# EAGLE design WEMOS_ESP32_2S_V4_for_S3 (EAGLE 9.6.2)
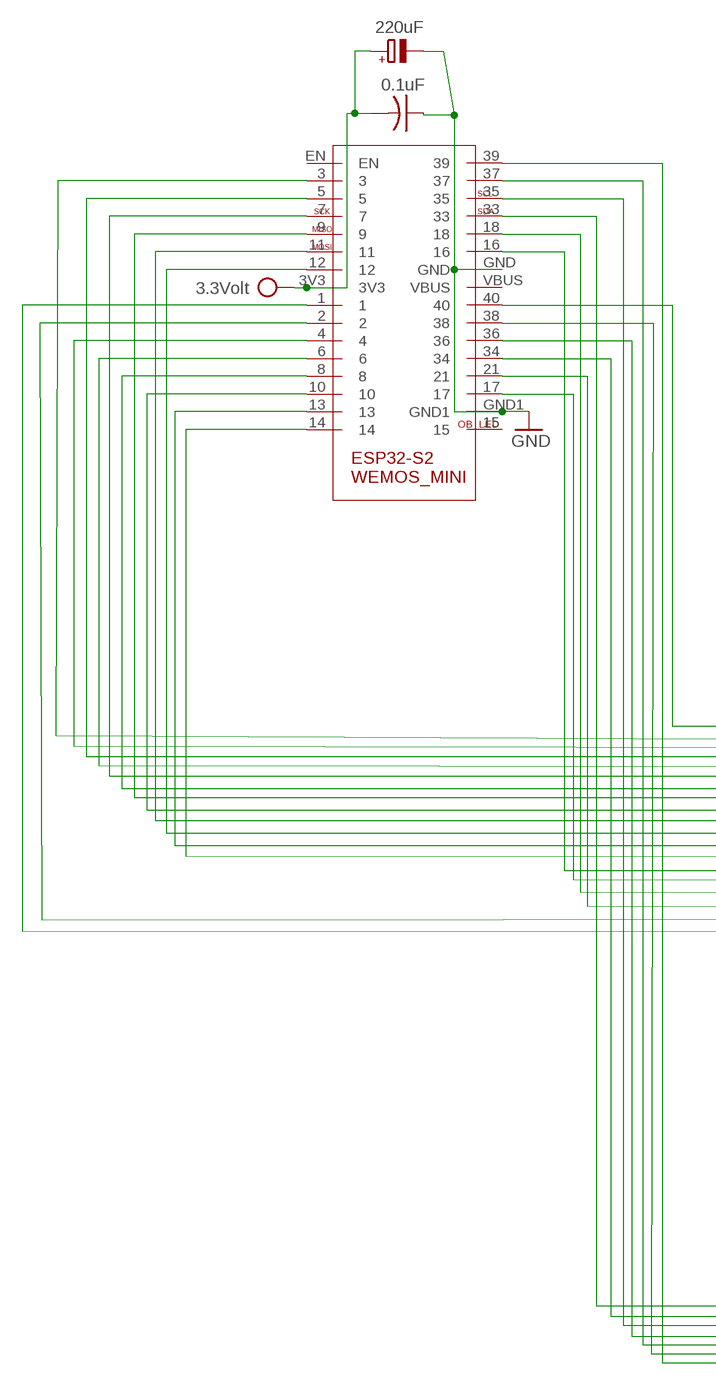
[diagram p0: schematic, sheet 1, part 1 of 2]
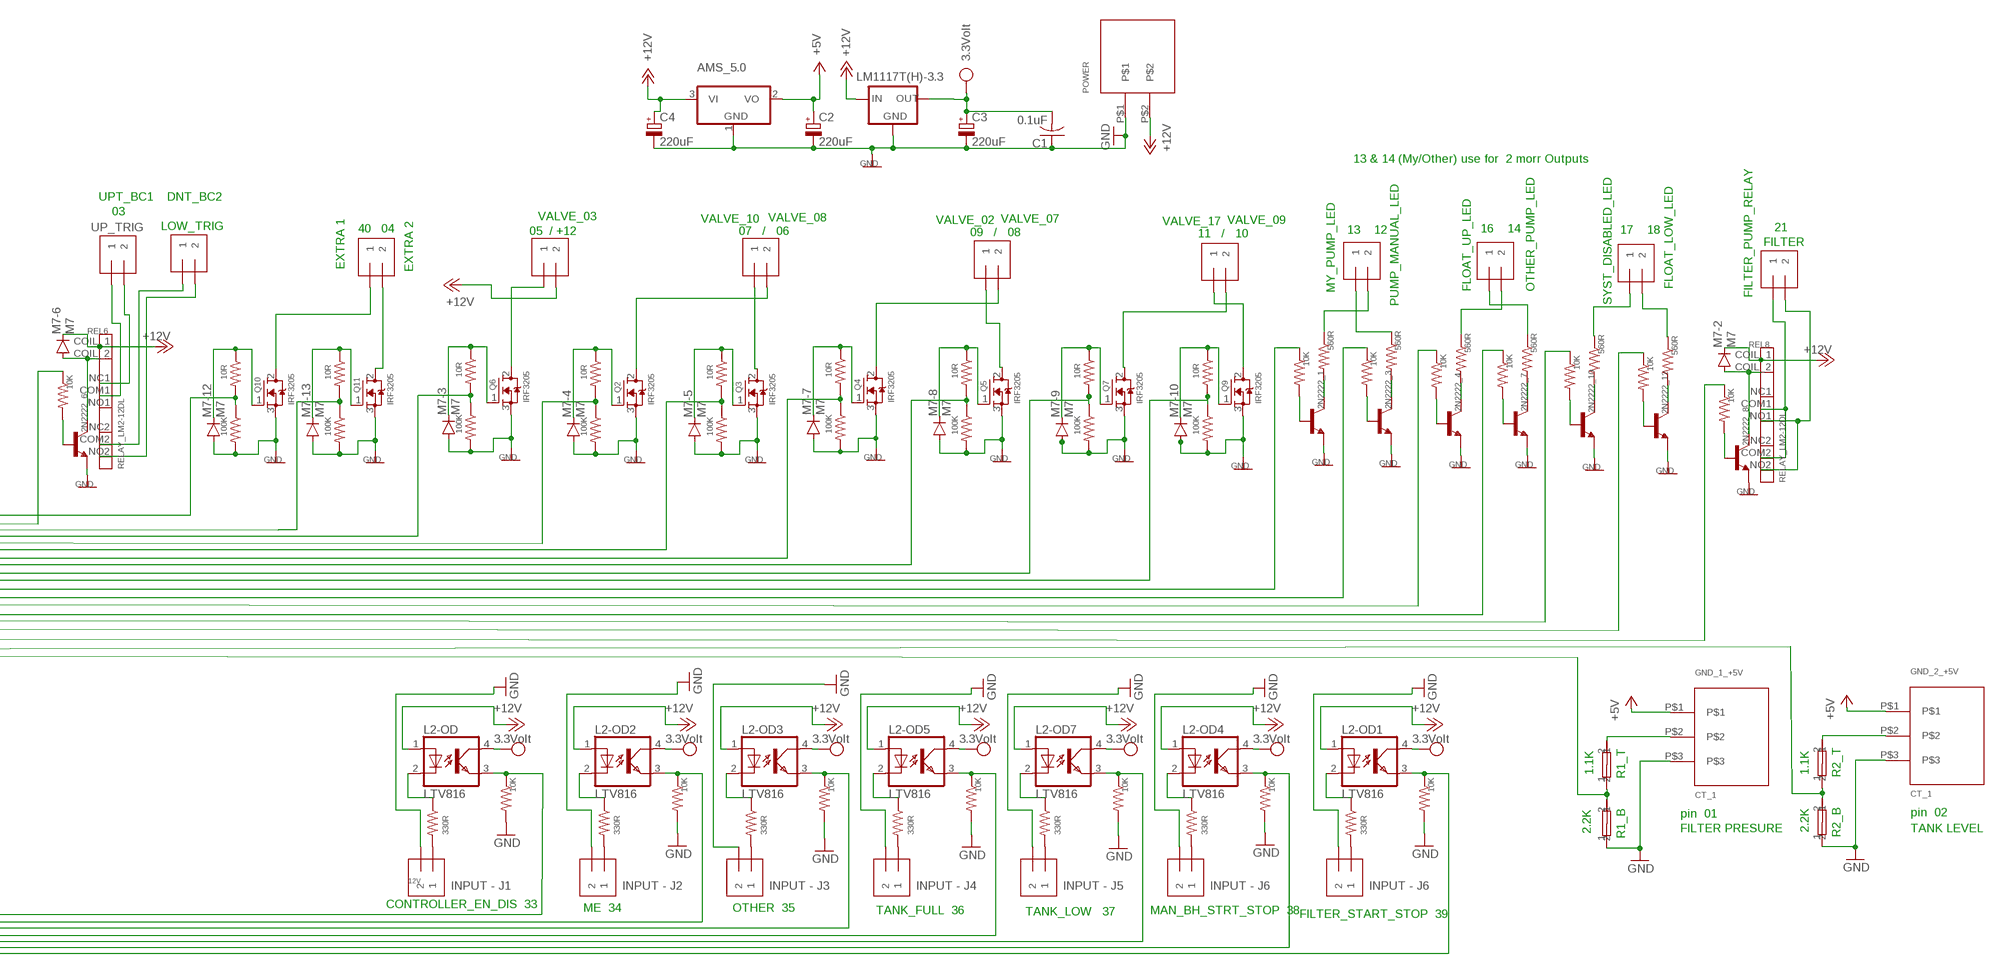
[diagram p1: schematic, sheet 1, part 2 of 2]

## Parts
2N2222_1  2N3904  [TO92]
2N2222_3  2N3904  [TO92]
2N2222_4  2N3904  [TO92]
2N2222_6  2N3904  [TO92]
2N2222_7  2N3904  [TO92]
2N2222_8  2N3904  [TO92]
2N2222_10  2N3904  [TO92]
2N2222_12  2N3904  [TO92]
06__07  FLOAT  TERMINNAL-3.5MM-2-3.5MMDOUBLE  [1X2-3.5MM]
08__09  FLOAT  TERMINNAL-3.5MM-2-3.5MMDOUBLE  [1X2-3.5MM]
10__11  FLOAT  TERMINNAL-3.5MM-2-3.5MMDOUBLE  [1X2-3.5MM]
12__13  FLOAT  TERMINNAL-3.5MM-2-3.5MMDOUBLE  [1X2-3.5MM]
14__16  FLOAT  TERMINNAL-3.5MM-2-3.5MMDOUBLE  [1X2-3.5MM]
18__17  FLOAT  TERMINNAL-3.5MM-2-3.5MMDOUBLE  [1X2-3.5MM]
40__04  FLOAT  TERMINNAL-3.5MM-2-3.5MMDOUBLE  [1X2-3.5MM]
+12V_05  FLOAT  TERMINNAL-3.5MM-2-3.5MMDOUBLE  [1X2-3.5MM]
+_33  AAA  TERMINNAL-3.5MM-2-3.5MMDOUBLE  [1X2-3.5MM]
+_34  TERMINNAL-3.5MM-2-3.5MMDOUBLE  [1X2-3.5MM]
+_35  TERMINNAL-3.5MM-2-3.5MMDOUBLE  [1X2-3.5MM]
+_36  TERMINNAL-3.5MM-2-3.5MMDOUBLE  [1X2-3.5MM]
+_37  TERMINNAL-3.5MM-2-3.5MMDOUBLE  [1X2-3.5MM]
+_38  TERMINNAL-3.5MM-2-3.5MMDOUBLE  [1X2-3.5MM]
+_39  TERMINNAL-3.5MM-2-3.5MMDOUBLE  [1X2-3.5MM]
AMS_5.0  AMS1117DB  [SOT223]
C1  0.1uF  C-US050-025X075  [C050-025X075]
C2  220uF  CPOL-EUE2.5-7  [E2,5-7]
C3  220uF  CPOL-EUE2.5-7  [E2,5-7]
C4  220uF  CPOL-EUE2.5-7  [E2,5-7]
C5  0.1uF  C-US050-025X075  [C050-025X075]
C6  220uF  CPOL-EUE2.5-7  [E2,5-7]
DNT_03  FLOAT  TERMINNAL-3.5MM-2-3.5MMDOUBLE  [1X2-3.5MM]
FIL__21  FILTER  TERMINNAL-3.5MM-2-3.5MMDOUBLE  [1X2-3.5MM]
GND_1_+5V  CT_1  TERMINAL-3.5MM-3TERMINAL  [1X3-3.5MM_TERM]
GND_2_+5V  CT_1  TERMINAL-3.5MM-3TERMINAL  [1X3-3.5MM_TERM]
IC1  LM1117T(H)-3.3  [TO220H]
L2-OD  LTV816  [DIL04]
L2-OD1  LTV816  [DIL04]
L2-OD2  LTV816  [DIL04]
L2-OD3  LTV816  [DIL04]
L2-OD4  LTV816  [DIL04]
L2-OD5  LTV816  [DIL04]
L2-OD7  LTV816  [DIL04]
M7-2  M7  DIODE-SOD106-R  [SOD106-R]
M7-3  M7  DIODE-SOD106-R  [SOD106-R]
M7-4  M7  DIODE-SOD106-R  [SOD106-R]
M7-5  M7  DIODE-SOD106-R  [SOD106-R]
M7-6  M7  DIODE-SOD106-R  [SOD106-R]
M7-7  M7  DIODE-SOD106-R  [SOD106-R]
M7-8  M7  DIODE-SOD106-R  [SOD106-R]
M7-9  M7  DIODE-SOD106-R  [SOD106-R]
M7-10  M7  DIODE-SOD106-R  [SOD106-R]
M7-12  M7  DIODE-SOD106-R  [SOD106-R]
M7-13  M7  DIODE-SOD106-R  [SOD106-R]
POWER  TERMINAL-5.08MM-2BIG_HOLE  [TERM-5.05-2_BH]
Q2  IRF3205  MOSFET-NGDS_TO220V  [TO220V]
Q3  IRF3205  MOSFET-NGDS_TO220V  [TO220V]
Q4  IRF3205  MOSFET-NGDS_TO220V  [TO220V]
Q5  IRF3205  MOSFET-NGDS_TO220V  [TO220V]
Q6  IRF3205  MOSFET-NGDS_TO220V  [TO220V]
Q7  IRF3205  MOSFET-NGDS_TO220V  [TO220V]
Q9  IRF3205  MOSFET-NGDS_TO220V  [TO220V]
Q10  IRF3205  MOSFET-NGDS_TO220V  [TO220V]
Q11  IRF3205  MOSFET-NGDS_TO220V  [TO220V]
R1  10K  R-US_R0805  [R0805]
R1_B  2.2K  RESISTOR  [0207/10]
R1_B1  2.2k  RESISTOR  [0207/10]
R1_T  1.1K  RESISTOR  [0207/10]
R2  100K  R-US_R0805  [R0805]
R2_T1  1.1K  RESISTOR  [0207/10]
R3  330R  R-US_R0805  [R0805]
R4  560R  R-US_R0805  [R0805]
R5  10R  R-US_R0805  [R0805]
R6  100K  R-US_R0805  [R0805]
R7  10K  R-US_R0805  [R0805]
R8  10R  R-US_R0805  [R0805]
R9  100K  R-US_R0805  [R0805]
R10  10K  R-US_R0805  [R0805]
R11  10R  R-US_R0805  [R0805]
R12  330R  R-US_R0805  [R0805]
R13  10K  R-US_R0805  [R0805]
R14  330R  R-US_R0805  [R0805]
R15  10K  R-US_R0805  [R0805]
R16  330R  R-US_R0805  [R0805]
R17  10K  R-US_R0805  [R0805]
R18  330R  R-US_R0805  [R0805]
R19  10K  R-US_R0805  [R0805]
R20  100K  R-US_R0805  [R0805]
R22  330R  R-US_R0805  [R0805]
R23  10K  R-US_R0805  [R0805]
R24  10K  R-US_R0805  [R0805]
R25  10R  R-US_R0805  [R0805]
R26  100K  R-US_R0805  [R0805]
R27  10R  R-US_R0805  [R0805]
R28  100K  R-US_R0805  [R0805]
R29  330R  R-US_R0805  [R0805]
R30  10K  R-US_R0805  [R0805]
R31  10R  R-US_R0805  [R0805]
R32  100K  R-US_R0805  [R0805]
R34  10K  R-US_R0805  [R0805]
R35  560R  R-US_R0805  [R0805]
R36  10K  R-US_R0805  [R0805]
R37  560R  R-US_R0805  [R0805]
R38  10R  R-US_R0805  [R0805]
R40  10K  R-US_R0805  [R0805]
R41  560R  R-US_R0805  [R0805]
R43  10R  R-US_R0805  [R0805]
R44  10K  R-US_R0805  [R0805]
R45  560R  R-US_R0805  [R0805]
R46  100K  R-US_R0805  [R0805]
R47  10R  R-US_R0805  [R0805]
R48  10K  R-US_R0805  [R0805]
R49  560R  R-US_R0805  [R0805]
R50  100K  R-US_R0805  [R0805]
REL6  RELAY_LM2-12DL  [RELAY4078]
REL8  RELAY_LM2-12DL  [RELAY4078]
U$1  WEMOS_S2_MINI  [WEMOS_S2_MINI]
UPT_03  FLOAT  TERMINNAL-3.5MM-2-3.5MMDOUBLE  [1X2-3.5MM]

## Nets
+5V [12V]: AMS_5.0.2(VO) C2.+ GND_1_+5V.P$1 GND_2_+5V.P$1
+12V [12V]: +12V_05.2 AMS_5.0.3(VI) C4.+ IC1.3(IN) L2-OD1.1(A) L2-OD2.1(A) L2-OD3.1(A) L2-OD4.1(A) L2-OD5.1(A) L2-OD7.1(A) L2-OD.1(A) M7-2.C M7-6.C POWER.P$2 REL6.COIL_1(COIL1) REL8.COIL_1(COIL1)
GND [GND]: 2N2222_1.3(E) 2N2222_3.3(E) 2N2222_4.3(E) 2N2222_6.3(E) 2N2222_7.3(E) 2N2222_8.3(E) 2N2222_10.3(E) 2N2222_12.3(E) +_33.2 +_34.2 +_35.2 +_36.2 +_37.2 +_38.2 +_39.2 AMS_5.0.1(GND) C1.1 C2.- C3.- C4.- C5.1 C6.- GND_1_+5V.P$3 GND_2_+5V.P$3 IC1.1(GND) M7-3.A M7-4.A M7-5.A M7-7.A M7-8.A M7-9.A M7-10.A M7-12.A M7-13.A POWER.P$1 Q2.3(S) Q3.3(S) Q4.3(S) Q5.3(S) Q6.3(S) Q7.3(S) Q9.3(S) Q10.3(S) Q11.3(S) R1_B1.1 R1_B.1 R2.2 R6.2 R7.2 R9.2 R13.2 R15.2 R17.2 R19.2 R20.2 R23.2 R26.2 R28.2 R30.2 R32.2 R46.2 R50.2 U$1.GND U$1.GND1
N$1 [POWER]: 08__09.1 Q5.2(D)
N$2: 2N2222_6.2(B) R10.2
N$3: REL6.COM1 UPT_03.1
N$4: R47.2 R50.1 U$1.4
N$5: L2-OD.2(C) R3.1
N$6: R43.2 R46.1 U$1.40
N$7: M7-3.C Q6.1(G) R38.1
N$8: R2.1 R38.2 U$1.5
N$9 [POWER]: 10__11.2 Q7.2(D)
N$10: R1_B1.2 R2_T1.1 U$1.2
N$11: 2N2222_8.2(B) R24.2
N$12 [POWER]: 40__04.2 Q11.2(D)
N$13 [POWER]: 06__07.2 Q2.2(D)
N$14: 2N2222_1.1(C) R4.2
N$15 [POWER]: 06__07.1 Q3.2(D)
N$16: M7-7.C Q4.1(G) R11.1
N$17: R10.1 U$1.3
N$18: R11.2 R20.1 U$1.8
N$19 [POWER]: 08__09.2 Q4.2(D)
N$20: L2-OD1.2(C) R29.1
N$21: +_39.1 R29.2
N$22 [POWER]: +12V_05.1 Q6.2(D)
N$23: M7-4.C Q2.1(G) R5.1
N$24: R5.2 R6.1 U$1.6
N$25: R1.1 U$1.12
N$26: M7-5.C Q3.1(G) R8.1
N$27: R8.2 R9.1 U$1.7
N$28: +_33.1 R3.2
N$29: M7-8.C Q5.1(G) R25.1
N$30: R25.2 R26.1 U$1.9
N$31: 2N2222_1.2(B) R1.2
N$32: M7-9.C Q7.1(G) R27.1
N$33: R27.2 R28.1 U$1.10
N$34: 12__13.2 R4.1
N$35: L2-OD7.3(EMIT) R23.1 U$1.37
N$36: 12__13.1 R35.1
N$37: 14__16.2 R37.1
N$38 [POWER]: 10__11.1 Q9.2(D)
N$39: M7-10.C Q9.1(G) R31.1
N$40: R31.2 R32.1 U$1.11
N$41: L2-OD2.3(EMIT) R13.1 U$1.34
N$42: L2-OD.3(EMIT) R7.1 U$1.33
N$43: R34.1 U$1.13
N$44: 2N2222_3.2(B) R34.2
N$45: 2N2222_3.1(C) R35.2
N$46: L2-OD1.3(EMIT) R30.1 U$1.39
N$47: L2-OD2.2(C) R12.1
N$48: R36.1 U$1.14
N$49: R1_B.2 R1_T.1 U$1.1
N$50: 2N2222_4.2(B) R36.2
N$51: 2N2222_4.1(C) R37.2
N$52: 14__16.1 R41.1
N$53: 18__17.1 R45.1
N$54: 18__17.2 R49.1
N$55: +_34.1 R12.2
N$56: L2-OD5.3(EMIT) R19.1 U$1.36
N$57: GND_1_+5V.P$2 R1_T.2
N$58: L2-OD3.2(C) R14.1
N$59: GND_2_+5V.P$2 R2_T1.2
N$60: +_35.1 R14.2
N$61: L2-OD3.3(EMIT) R15.1 U$1.35
N$62: 2N2222_6.1(C) M7-6.A REL6.COIL_2(COIL2)
N$63: DNT_03.2 REL6.NO2
N$64: R40.1 U$1.16
N$65: REL6.NC1 UPT_03.2
N$66: 2N2222_7.2(B) R40.2
N$67: 2N2222_7.1(C) R41.2
N$68: DNT_03.1 REL6.COM2
N$69: L2-OD4.2(C) R16.1
N$70 [POWER]: 40__04.1 Q10.2(D)
N$71: +_38.1 R16.2
N$72: L2-OD4.3(EMIT) R17.1 U$1.38
N$74: L2-OD5.2(C) R18.1
N$76: +_36.1 R18.2
N$78: M7-12.C Q10.1(G) R43.1
N$79: R44.1 U$1.17
N$80: 2N2222_10.2(B) R44.2
N$81: 2N2222_10.1(C) R45.2
N$83: M7-13.C Q11.1(G) R47.1
N$84: L2-OD7.2(C) R22.1
N$86: +_37.1 R22.2
N$89: R48.1 U$1.18
N$90: 2N2222_12.2(B) R48.2
N$91: 2N2222_12.1(C) R49.2
N$101: 2N2222_8.1(C) M7-2.A REL8.COIL_2(COIL2)
N$103 [POWER]: FIL__21.2 REL8.NO1 REL8.NO2
N$106 [POWER]: FIL__21.1 REL8.COM1 REL8.COM2
N$109: R24.1 U$1.21
VCC [3V]: C1.2 C3.+ C5.2 C6.+ IC1.2(OUT) L2-OD1.4(COL) L2-OD2.4(COL) L2-OD3.4(COL) L2-OD4.4(COL) L2-OD5.4(COL) L2-OD7.4(COL) L2-OD.4(COL) U$1.3V3
Unconnected: REL6.NC2 REL6.NO1 REL8.NC1 REL8.NC2 U$1.15 U$1.EN U$1.VBUS

## Notes on the sheet
- 13 & 14 (My/Other) use for  2 morr Outputs
- UPT_BC1 | DNT_BC2
- 03
- VALVE_03 | VALVE_10 | VALVE_08 | VALVE_07
- VALVE_02 | VALVE_17 | VALVE_09
- UP_TRIG | LOW_TRIG | 40 | 04 | 16 | 14 | 21
- 05  / +12 | 07   /   06 | 09   /   08 | 13 | 12 | 17 | 18
- 11   /   10
- FILTER
- EXTRA 1 | EXTRA 2
- FLOAT_UP_LED | OTHER_PUMP_LED | FLOAT_LOW_LED
- MY_PUMP_LED
- FILTER_PUMP_RELAY
- PUMP_MANUAL_LED | SYST_DISABLED_LED
- 1.1K | 1.1K | R2_T
- R1_T
- pin  01 | pin  02
- 2.2K | FILTER PRESURE | 2.2K | TANK LEVEL
- R1_B | R2_B
- 12V
- INPUT - J1 | INPUT - J2 | INPUT - J3 | INPUT - J4 | INPUT - J5 | INPUT - J6 | INPUT - J6
- CONTROLLER_EN_DIS  33
- ME  34 | OTHER  35 | TANK_FULL  36 | MAN_BH_STRT_STOP  38
- TANK_LOW   37 | FILTER_START_STOP  39

## Library data of the parts
2N2222_1 2N2222_3 2N2222_4 2N2222_6-2N2222_8 2N2222_10 2N2222_12 = transistor:2N3904: NPN TRANSISTOR
06__07 08__09 10__11 12__13 14__16 18__17 40__04 +12V_05 +_33-+_39 DNT_03 FIL__21 UPT_03 = BDV_02:TERMINNAL-3.5MM-2: 3.5mm Terminal block http://www.ladyada.net/library/pcb/eaglelibrary.html
AMS_5.0 = BDV_01:AMS1117: 250 mA, 16V, Low Quiescent Current LDO Regulator Source: http://ww1.microchip.com/downloads/en/DeviceDoc/22049b.pdf
C1 C5 = adafruit:C-US: CAPACITOR, American symbol
C2-C4 C6 = resistor:CPOL-EU: POLARIZED CAPACITOR, European symbol
GND_1_+5V GND_2_+5V = BDV_02:TERMINAL-3.5MM-3: 3 Pin Connector
IC1 = lm1117_10:LM1117?-*: 800mA Low-Dropout Linear Regulator Source: http://www.ti.com/lit/ds/symlink/lm1117-n.pdf; MF: Texas Instruments; MPN: LM1117T-3.3; OC_FARNELL: 1469056; OC_NEWARK: 13B5347
L2-OD L2-OD1-L2-OD5 L2-OD7 = optocoupler:LTV816: OPTO COUPLER Source: LITEON, LTV816.pdf; OC_FARNELL: unknown; OC_NEWARK: unknown
M7-2-M7-10 M7-12 M7-13 = diode:DIODE-: DIODE
POWER = BDV_02:TERMINAL-5.08MM-2: Terminal 5.08mm - 2
Q2-Q7 Q9-Q11 = adafruit:MOSFET-N: N-Channel Mosfet 2N7002E - 60V 260mA SOT23 [Digikey: 2N7002ET1GOSTR-ND] - REEL BSH103 - 30V 850mA SOT23 [Digikey: 568-5013-1-ND]
R1-R20 R22-R32 R34-R38 R40 R41 R43-R50 = resistor:R-US_: RESISTOR, American symbol
R1_B R1_B1 R1_T R2_T1 = BDV_02:RESISTOR
REL6 REL8 = BDV_02:RELAY_LM2-12DL: Relay Small Symbol
U$1 = BDV_02:WEMOS_S2_MINI: WEMOS_MINI

## Net classes
0 default: width 0.305 mm, drill 0.305 mm, clearance 0.305 mm
1 POWER: width 0.889 mm, drill 0.508 mm, clearance 0.305 mm to class 0, clearance 0.508 mm
2 12V: width 0.889 mm, drill 0.508 mm, clearance 0.305 mm to class 0, clearance 0.508 mm
3 ground: width 0.889 mm, drill 0.508 mm, clearance 0.305 mm to class 0, clearance 0.305 mm to class 1, clearance 0.305 mm to class 2, clearance 0.305 mm
4 3V: width 0.635 mm, drill 0.508 mm, clearance 0.305 mm to class 0, clearance 0.508 mm
5 GND: width 0.889 mm, drill 0.508 mm, clearance 0.305 mm to class 0, clearance 0.508 mm

## Board
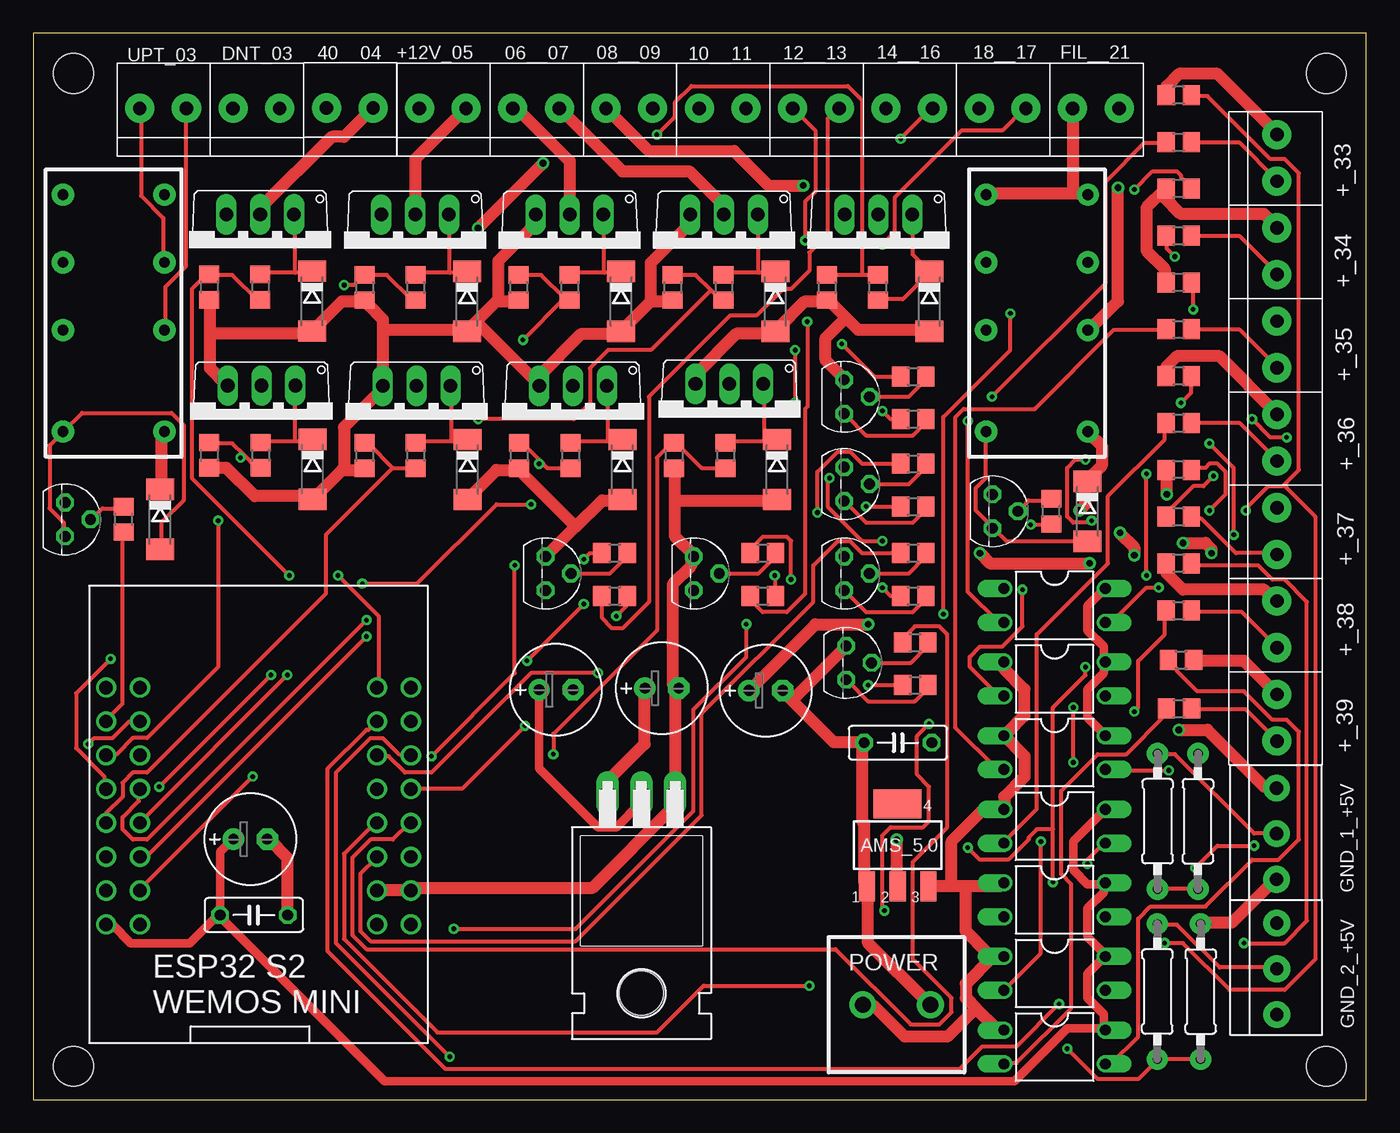
[diagram p2: board, top side]
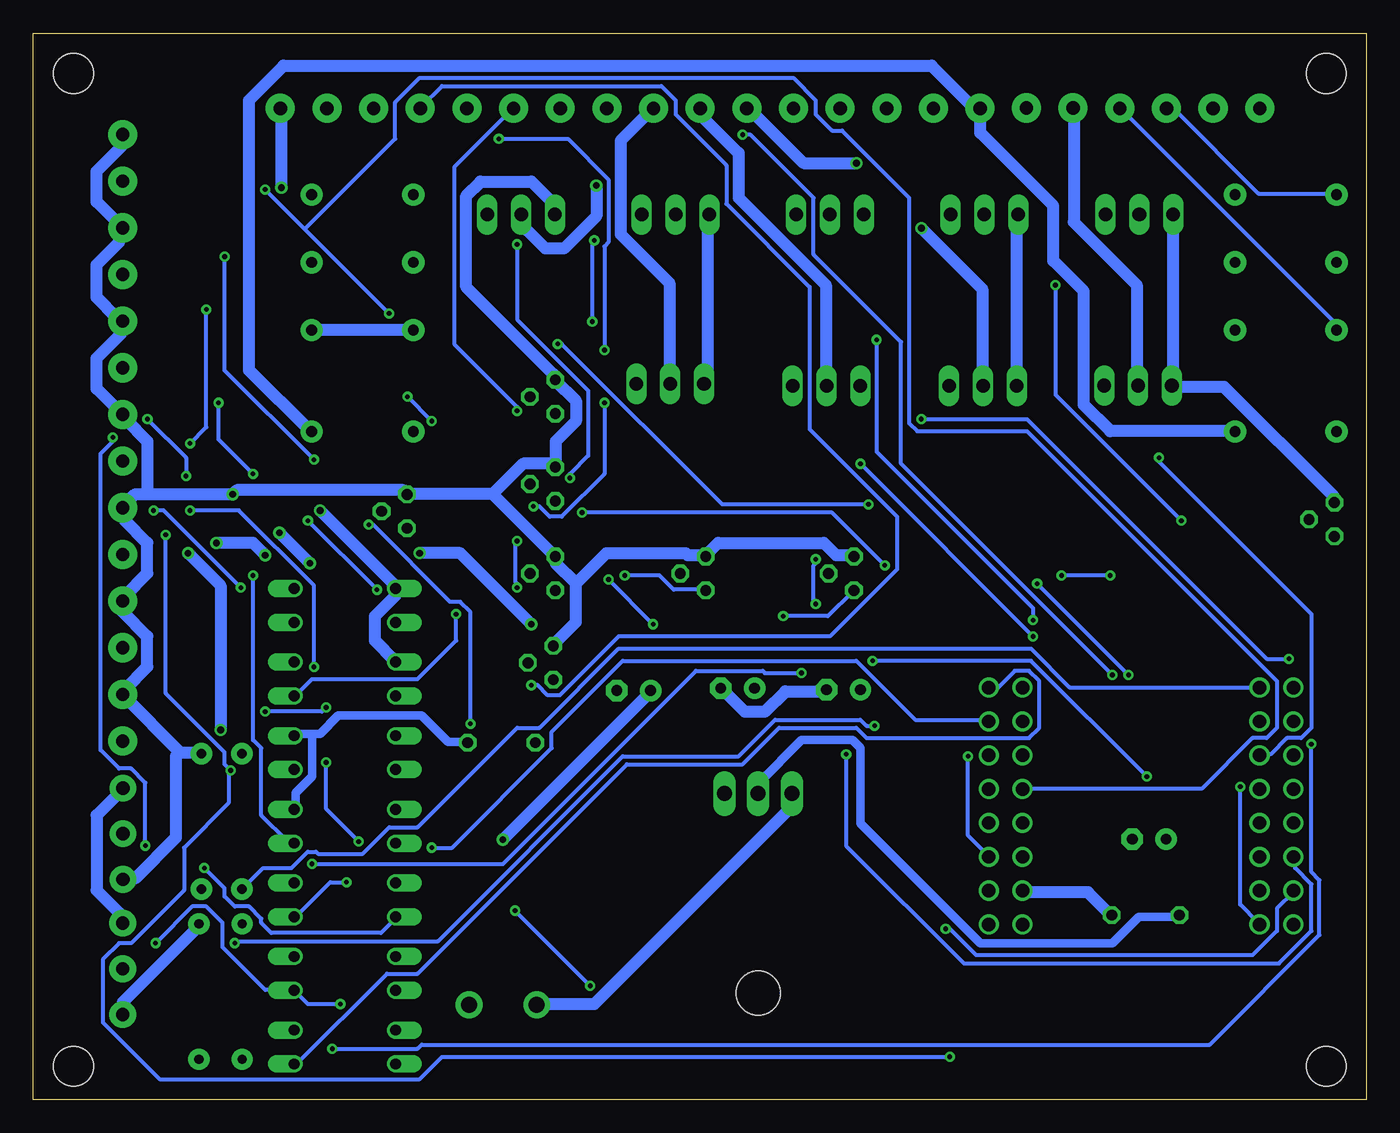
[diagram p3: board, bottom side, seen from below]

Size 100 x 80 mm. Coordinates in mm from the lower left corner, seen from the top.
Outline: 0,0 100,0 100,80 0,80 0,0
Copper layers (1*16): Top 0.035mm / dielectric 1.5mm / Bottom 0.035mm
Design rules "default *": minimum track width 6mil, minimum drill 0.35mm, track to track 6mil, track to pad 6mil, pad to pad 6mil, via to via 6mil, smd to smd 6mil, copper to edge 40mil, drill to drill 6mil, minimum pad ring 10mil, minimum via ring 8mil, stop-mask expansion 4mil, vias tented up to drill 20mil, thermal gap 10mil
Holes 3 mm at 3,77 3,2.5 97,2.5 97,77

### Footprints (pad centres in the part's own frame; a part is rotated, then mirrored left to right if it is on the bottom)
TO92 = drill 0.813 octagon: 1 1.27,0; 2 0,1.905; 3 -1.27,0
1X2-3.5MM = drill 1 pad 2.184: 1 1.8,0; 2 -1.7,0
SOT223 = smd 1.219 x 2.235: 1 -2.311,-3.099; 2 0,-3.099; 3 2.311,-3.099 | smd 3.6 x 2.2: 4 0,3.099
C050-025X075 = drill 0.813 octagon: 1 -2.54,0; 2 2.54,0
E2,5-7 = drill 0.813 pad 1.6: + -1.27,0 | drill 0.813 pad 1.6 octagon: - 1.27,0
1X3-3.5MM_TERM = drill 1 pad 2: P$1 -3.32,-0.586; P$2 0.1,-0.586; P$3 3.52,-0.586
TO220H = drill 1.118 long: 1 -2.54,-10.16; 2 0,-10.16; 3 2.54,-10.16 | hole 3.302: 0,4.826
DIL04 = drill 0.813 offset: 1 -1.27,-3.81; 2 1.27,-3.81; 3 1.27,3.81; 4 -1.27,3.81
SOD106-R = smd 1.6 x 2.1: A 2.25,0; C -2.25,0
TERM-5.05-2_BH = drill 1.2 pad 2: P$1 0,2.54; P$2 0,-2.54
TO220V = drill 1.016 long: 1 -2.54,-2.54; 2 0,-2.54; 3 2.54,-2.54
R0805 = smd 1.3 x 1.5: 1 -0.95,0; 2 0.95,0
0207/10 = drill 0.7 pad 1.6: 1 -5.08,0; 2 5.08,0
RELAY4078 = drill 0.8 pad 1.676: COIL_1 -3.81,8.89; COIL_2 3.81,8.89; COM1 -3.81,1.27; COM2 3.81,1.27; NC1 -3.81,-3.81; NC2 3.81,-3.81; NO1 -3.81,-8.89; NO2 3.81,-8.89
WEMOS_S2_MINI = drill 1: 1 -8.89,10.16; 2 -8.89,7.62; 3 -11.43,7.62; 3V3 -11.43,-7.62; 4 -8.89,5.08; 5 -11.43,5.08; 6 -8.89,2.54; 7 -11.43,2.54; 8 -8.89,0; 9 -11.43,0; 10 -8.89,-2.54; 11 -11.43,-2.54; 12 -11.43,-5.08; 13 -8.89,-5.08; 14 -8.89,-7.62; 15 8.89,-7.62; 16 11.43,-2.54; 17 8.89,-2.54; 18 11.43,0; 21 8.89,0; 33 11.43,2.54; 34 8.89,2.54; 35 11.43,5.08; 36 8.89,5.08; 37 11.43,7.62; 38 8.89,7.62; 39 11.43,10.16; 40 8.89,10.16; EN -11.43,10.16; GND 11.43,-5.08; GND1 8.89,-5.08; VBUS 11.43,-7.62

### Placement (x,y rotation side)
2N2222_1  49.56,39.47 270 top
2N2222_3  38.43,39.47 270 top
2N2222_4  60.83,52.73 270 top
2N2222_6  2.38,43.53 270 top
2N2222_7  60.83,46.18 270 top
2N2222_8  71.96,44.14 270 top
2N2222_10  60.83,39.47 270 top
2N2222_12  60.99,32.77 270 top
06__07  37.67,74.37 0 top
08__09  44.67,74.37 0 top
10__11  51.67,74.37 0 top
12__13  58.67,74.37 0 top
14__16  65.67,74.37 0 top
18__17  72.67,74.37 0 top
40__04  23.7,74.4 0 top
+12V_05  30.67,74.37 0 top
+_33  93.3,70.7 270 top
+_34  93.3,63.7 270 top
+_35  93.3,56.7 270 top
+_36  93.3,49.7 270 top
+_37  93.3,42.7 270 top
+_38  93.3,35.7 270 top
+_39  93.3,28.7 270 top
AMS_5.0  64.85,19.09 0 top
C1  64.87,26.77 0 top
C2  54.95,30.68 0 top
C3  39.22,30.75 0 top
C4  47.16,30.86 0 top
C5  16.55,13.84 180 top
C6  16.28,19.53 0 top
DNT_03  16.69,74.37 0 top
FIL__21  79.67,74.37 0 top
GND_1_+5V  93.85,20.04 270 top
GND_2_+5V  93.88,9.91 270 top
IC1  45.62,12.8 180 top
L2-OD  76.63,37.07 270 top
L2-OD1  76.63,3.94 270 top
L2-OD2  76.63,31.55 270 top
L2-OD3  76.63,26.03 270 top
L2-OD4  76.63,9.46 270 top
L2-OD5  76.63,20.5 270 top
L2-OD7  76.63,14.98 270 top
M7-2  79.08,44.14 270 top
M7-3  32.54,59.88 270 top
M7-4  44.1,59.88 270 top
M7-5  55.67,59.88 270 top
M7-6  9.5,43.53 270 top
M7-7  67.23,59.88 270 top
M7-8  32.57,47.27 270 top
M7-9  44.19,47.27 270 top
M7-10  55.8,47.27 270 top
M7-12  20.9,59.91 270 top
M7-13  20.94,47.29 270 top
POWER  64.77,7.11 270 top
Q2  40.23,63.86 180 top
Q3  51.82,63.86 180 top
Q4  63.4,63.86 180 top
Q5  28.75,51 180 top
Q6  28.65,63.86 180 top
Q7  40.49,51 180 top
Q9  52.22,51.16 180 top
Q10  17.02,63.88 180 top
Q11  17.12,51.03 180 top
R1  54.74,41 0 top
R1_B  87.38,20.88 270 top
R1_B1  87.58,8.1 270 top
R1_T  84.35,20.88 90 top
R2  24.84,60.93 270 top
R2_T1  84.33,8.1 90 top
R3  85.93,71.84 0 top
R4  54.74,37.8 0 top
R5  40.23,60.93 270 top
R6  36.41,60.93 270 top
R7  85.93,75.36 180 top
R8  51.8,60.93 270 top
R9  47.97,60.93 270 top
R10  6.78,43.53 90 top
R11  63.36,60.93 90 top
R12  85.93,64.82 0 top
R13  85.93,68.33 180 top
R14  85.93,57.79 0 top
R15  85.93,61.3 180 top
R16  85.93,36.71 0 top
R17  85.93,40.22 180 top
R18  85.93,50.76 0 top
R19  85.93,54.28 180 top
R20  59.54,60.93 270 top
R22  85.93,43.74 0 top
R23  85.93,47.25 180 top
R24  76.36,44.14 90 top
R25  28.69,48.32 270 top
R26  24.84,48.32 270 top
R27  40.3,48.32 270 top
R28  36.46,48.32 270 top
R29  85.95,29.34 0 top
R30  86.11,32.99 0 top
R31  51.92,48.32 270 top
R32  48.07,48.32 270 top
R34  43.61,41 0 top
R35  43.61,37.8 0 top
R36  66.01,54.25 0 top
R37  66.01,51.05 0 top
R38  28.67,60.93 270 top
R40  66.01,47.7 0 top
R41  66.01,44.5 0 top
R43  17.04,60.96 270 top
R44  66.01,41 0 top
R45  66.01,37.8 0 top
R46  13.21,60.96 270 top
R47  17.05,48.35 270 top
R48  66.17,34.29 0 top
R49  66.17,31.09 0 top
R50  13.21,48.35 270 top
REL6  6.02,59 180 top
REL8  75.31,59 180 top
U$1  16.89,20.75 0 top
UPT_03  9.69,74.37 0 top

### Tracks (layer width: path | path; a pad name or v marks a point on that pad's centre or on a via)
+5V  (via drill 0.51)
  Top 0.889: v64.77,19.51 64.77,16 AMS_5.0.2 | v85.95,27.74 88.09,27.74 92.35,23.47 93.12,23.47 GND_1_+5V.P$1 | v88.39,41 88.39,41.3 87.94,41.76 v86.26,41.76 | v82.6,40.84 82.6,41.45 v81.53,42.52 | v79.25,40.23 71.78,40.23 v71.02,41 | v62.64,35.66 58.67,35.66 53.8,30.79 C2.+
  Bottom 0.889: GND_2_+5V.P$1 93.42,13.26 93.42,13.87 95.25,15.7 95.25,21.34 93.27,23.32 GND_1_+5V.P$1 | v64.77,19.51 53.65,30.63 C2.+ | v85.95,27.74 85.95,38.56 v88.39,41 | v86.26,41.76 83.52,41.76 v82.6,40.84 | v79.25,40.23 v81.53,42.52 | v71.02,41 67.97,41 v62.64,35.66
+12V  (via drill 0.51)
  Top 0.889: M7-6.C 9.6,45.87 9.6,49.84 9.75,49.99 REL6.COIL_1 | REL8.COIL_1 79.25,49.99 80.16,49.07 80.16,47.55 79.1,46.48 M7-2.C 78.94,46.02 78.94,44.65 v78.49,44.2 | L2-OD2.1 72.85,32.77 72.85,32.31 74.37,30.79 74.37,28.8 73.15,27.58 L2-OD3.1 72.85,27.28 74.37,25.76 74.37,24.23 72.85,22.71 72.85,21.79 L2-OD5.1 72.39,21.64 71.17,21.64 68.89,19.36 68.89,16 | C4.+ 45.87,30.79 45.87,26.67 43.13,23.93 43.13,23.01 IC1.3 | 69.95,16 72.54,16 72.69,16.15 L2-OD7.1 | 69.95,16 68.89,16 | 68.89,16 67.21,16 AMS_5.0.3 | 70.71,6.86 69.95,7.62 69.95,8.69 71.93,10.67 72.69,10.67 L2-OD4.1 71.63,10.97 69.95,12.65 69.95,16 | 70.71,6.86 72.24,5.33 72.69,5.33 L2-OD1.1 | 70.71,6.86 68.58,4.72 65.38,4.72 63.09,7.01 62.33,7.01 POWER.P$2
  Bottom 0.889: REL6.COIL_1 9.91,50.14 19.2,50.14 21.18,52.12 21.18,60.66 23.47,62.94 23.47,67.06 28.96,72.54 28.96,74.37 +12V_05.2 29.41,74.37 32.61,77.57 81.23,77.57 83.82,74.98 83.82,54.71 79.25,50.14 REL8.COIL_1 | L2-OD2.1 72.85,32.92 74.37,34.44 74.37,36.27 72.85,37.8 72.85,38.25 L2-OD.1 73,38.71 v78.49,44.2 | IC1.3 43.13,22.86 43.13,21.95 57.91,7.16 62.18,7.16 POWER.P$2
GND  (via drill 0.51)
  Top 0.889: R7.2 85.04,75.44 85.04,76.05 85.95,76.96 88.85,76.96 93.27,72.54 +_33.2 | R15.2 84.89,61.42 84.89,62.33 83.52,63.7 83.52,66.9 84.89,68.28 R13.2 84.89,67.67 86.11,66.45 92.35,66.45 93.27,65.53 +_34.2 | v85.04,45.41 85.04,47.24 R23.2 | R19.2 85.04,54.41 85.04,55.02 85.8,55.78 89,55.78 93.27,51.51 +_36.2 | R1_B1.1 87.63,13.26 89.92,13.26 93.12,16.46 GND_1_+5V.P$3 | R17.2 85.04,40.08 85.04,39.47 86.26,38.25 92.35,38.25 93.27,37.34 +_38.2 | R30.2 87.17,32.92 90.83,32.92 93.27,30.48 +_39.2 | U$1.GND1 25.91,15.7 28.19,15.7 U$1.GND 28.65,15.85 41.91,15.85 48.01,21.95 48.01,22.55 IC1.1 48.16,30.63 48.31,30.79 C4.- 48.01,31.09 48.01,38.71 49.38,40.08 49.38,40.39 2N2222_1.3 49.53,40.84 48.16,42.22 48.16,44.96 | C5.1 19.05,13.87 19.05,18.14 17.68,19.51 C6.- | M7-8.A 32.61,45.11 34.75,47.24 36.42,47.24 R28.2 36.73,46.94 40.69,42.98 | 40.69,42.98 38.56,40.84 2N2222_3.3 | 40.69,42.98 42.67,44.96 44.04,44.96 M7-9.A | 48.16,44.96 48.16,47.24 R32.2 | 48.16,44.96 55.78,44.96 M7-10.A | 13.26,57.45 13.26,54.86 14.48,53.65 Q11.3 | 13.26,57.45 13.26,59.89 R46.2 | 46.33,59.89 47.85,59.89 R9.2 | 46.33,59.89 44.2,57.76 M7-4.A 43.74,57.45 41.15,57.45 37.95,54.25 Q7.3 37.95,53.65 33.53,58.06 M7-3.A | 46.33,59.89 46.33,62.79 49.23,65.68 49.23,66.29 Q3.3 | 34.9,59.89 34.75,59.89 32.61,57.76 M7-3.A | 34.9,59.89 36.27,59.89 R6.2 | 34.9,59.89 34.9,62.94 37.64,65.68 37.64,66.29 Q2.3 | 23.32,47.24 23.16,47.24 21.03,45.11 M7-13.A 20.57,45.26 16.61,45.26 14.48,47.4 R50.2 | 23.32,47.24 24.84,47.24 R26.2 | 26.21,57.76 26.21,58.52 25.15,59.59 R2.2 24.84,59.89 23.16,59.89 21.03,57.76 M7-12.A 20.57,57.45 13.26,57.45
  Top 0.889: 26.21,57.76 Q5.3 26.06,53.19 23.32,50.44 23.32,47.24 | 26.21,57.76 32.16,57.76 M7-3.A | 60.96,58.67 59.89,59.74 R20.2 59.44,59.89 57.91,59.89 55.78,57.76 M7-5.A 55.32,57.45 52.73,57.45 49.68,54.41 Q9.3 | 60.96,58.67 61.87,57.76 67.21,57.76 M7-7.A | 60.96,58.67 59.44,57.15 59.44,55.47 60.81,54.1 2N2222_4.3 | POWER.P$1 67.21,7.16 62.64,11.73 62.64,15.85 AMS_5.0.1 62.33,16.31 62.33,20.73 62.18,20.88 62.18,26.36 C1.1 62.33,26.82 60.05,26.82 56.92,29.95 | 56.92,29.95 56.24,30.63 C2.- | 56.92,29.95 60.96,33.98 2N2222_12.3
  Bottom 0.889: +_33.2 93.42,72.39 93.42,71.48 95.25,69.65 95.25,67.36 93.42,65.53 +_34.2 93.57,65.08 93.57,64.31 95.25,62.64 95.25,60.2 93.73,58.67 +_35.2 93.42,58.37 93.42,57.45 95.25,55.63 95.25,53.34 93.42,51.51 +_36.2 93.12,51.05 91.44,49.38 91.44,45.41 | 91.44,45.41 92.35,45.41 93.27,44.5 +_37.2 93.12,44.04 93.12,43.43 91.44,41.76 91.44,39.47 93.12,37.8 +_38.2 93.27,37.34 93.27,36.58 91.44,34.75 91.44,32.46 93.12,30.79 +_39.2 93.27,30.33 89,26.06 | 91.44,45.41 v85.04,45.41 84.73,45.72 72.24,45.72 2N2222_8.3 71.93,45.41 65.53,45.41 | GND_2_+5V.P$3 93.27,6.4 93.27,7.32 87.48,13.11 R1_B1.1 | 89,26.06 87.48,26.06 R1_B.1 | GND_1_+5V.P$3 93.12,16.61 92.35,16.61 89.31,19.66 89.31,25.76 89,26.06 | U$1.GND1 25.76,15.54 20.88,15.54 19.2,13.87 C5.1 | C3.- 40.54,30.63 43.59,30.63 45.11,29.11 46.63,29.11 48.31,30.79 C4.- | 2N2222_3.3 38.56,40.84 39.78,40.84 40.69,41.76 48.62,41.76 49.53,40.84 2N2222_1.3 49.99,40.84 50.9,40.84 51.05,41 57,41 59.28,38.71 | 2N2222_6.3 2.44,44.81 2.44,45.26 10.67,53.49 14.48,53.49 Q11.3 14.48,53.95 Q10.3 | Q5.3 26.21,66.29 Q6.3 | 65.53,45.41 63.25,47.7 61.11,47.7 2N2222_7.3 60.81,47.55 60.81,49.38 59.28,50.9 59.28,52.43 60.81,53.95 2N2222_4.3 60.96,54.41 67.51,60.96 67.51,67.82 66.45,68.89 62.64,68.89 60.96,67.21 60.96,66.45 Q4.3 | 59.28,38.71 60.81,40.23 60.81,40.69 2N2222_10.3 61.11,41 65.53,45.41 | 59.28,38.71 59.28,35.81 60.96,34.14 2N2222_12.3 | Q3.3 49.38,66.29 49.38,54.1 49.68,53.8 Q9.3
N$1  (via drill 0.51)
  Top 0.889: v38.25,70.26 v33.38,65.38
  Bottom 0.889: v33.38,65.38 28.8,60.81 28.8,53.65 Q5.2 | v38.25,70.26 42.22,70.26 46.33,74.37 08__09.1
N$2
  Top 0.305: R10.2 6.71,44.35 5.18,44.35 4.42,43.59 2N2222_6.2
N$3
  Top 0.305: REL6.COM1 9.91,57.76 9.91,60.96 11.43,62.48 11.43,74.37 UPT_03.1
N$4  (via drill 0.35)
  Top 0.305: 15.77,48.39 16.76,47.4 R47.2 | 15.77,48.39 14.94,49.23 13.26,49.23 R50.1 | 15.77,48.39 v15.54,48.16
  Bottom 0.305: v15.54,48.16 15.54,47.85 4.12,36.42 4.12,27.89 4.88,27.13 5.94,27.13 7.16,25.91 7.92,25.91 U$1.4
N$5  (via drill 0.35)
  Top 0.305: v71.93,52.73 80.47,61.27 80.47,68.89 83.36,71.78 84.89,71.78 R3.1 | v70.1,50.9 70.1,38.1 72.39,35.81 72.69,35.81 L2-OD.2
  Bottom 0.305: v70.1,50.9 v71.93,52.73
N$6  (via drill 0.35)
  Top 0.305: R43.2 16.92,59.89 14.94,61.87 13.26,61.87 R46.1 13.11,62.03 11.89,60.81 11.89,46.63 v19.2,39.32 | v22.86,39.32 25.91,36.27 25.91,30.94 U$1.40
  Bottom 0.305: v19.2,39.32 v22.86,39.32
N$7
  Top 0.305: 31.24,62.03 32.46,62.03 M7-3.C | 31.24,62.03 28.8,62.03 R38.1 | 31.24,62.03 31.24,66.29 Q6.1
N$8  (via drill 0.35)
  Top 0.305: R2.1 26.52,61.87 28.35,60.05 28.65,60.05 R38.2 | v13.87,43.43 13.87,32.46 8.53,27.13 7.47,27.13 6.25,25.91 5.49,25.91 U$1.5 | v23.32,61.11 24.08,61.11 R2.1 | R2.1
  Bottom 0.305: v13.87,43.43 23.32,52.88 v23.32,61.11
N$9
  Bottom 0.889: Q7.2 40.54,53.65 40.54,61.11 47.09,67.67 47.09,71.02 49.84,73.76 49.84,74.37 10__11.2
N$10  (via drill 0.35)
  Top 0.305: v4.12,26.67 4.57,27.13 5.94,27.13 7.16,28.35 7.92,28.35 U$1.2 | v77.57,3.81 79.86,1.52 82.91,1.52 84.28,2.9 R2_T1.1 84.43,3.05 87.48,3.05 R1_B1.2
  Bottom 0.305: v4.12,26.67 4.12,17.07 3.5,16.46 3.5,12.34 11.73,4.12 70.87,4.12 71.17,3.81 v77.57,3.81
N$11
  Top 0.305: R24.2 76.35,44.96 74.68,44.96 73.91,44.2 2N2222_8.2
N$12
  Bottom 0.889: Q11.2 17.22,53.65 17.22,61.11 21.95,65.84 21.95,74.37 40__04.2
N$13
  Top 0.889: Q2.2 40.23,70.41 36.12,74.52 06__07.2
N$14  (via drill 0.35)
  Top 0.305: v55.63,39.32 55.63,37.8 R4.2
  Bottom 0.305: v55.63,39.32 53.03,39.32 51.97,38.25 49.68,38.25 2N2222_1.1
N$15
  Top 0.889: Q3.2 51.82,67.06 49.23,69.65 44.2,69.65 06__07.1
N$16
  Top 0.305: R11.1 63.4,60.05 65.23,60.05 67.21,62.03 M7-7.C 67.21,62.18 65.99,63.4 65.99,66.29 Q4.1
N$17
  Top 0.305: R10.1 6.71,42.52 6.71,29.72 5.49,28.5 U$1.3
N$18  (via drill 0.35)
  Top 0.305: 62.18,61.87 63.25,61.87 R11.2 | 62.18,61.87 59.59,61.87 R20.1 | 62.18,61.87 62.18,74.98 61.11,76.05 49.38,76.05 48.16,74.83 48.16,73.76 v46.79,72.39 | v19.05,31.85 8.08,20.88 U$1.8
  Bottom 0.305: v46.79,72.39 46.18,72.39 41.45,67.67 41.45,63.4 34.9,56.84 34.9,47.7 v19.05,31.85
N$19  (via drill 0.51)
  Top 0.889: v57.76,68.58 55.17,68.58 52.58,71.17 46.18,71.17 08__09.2
  Bottom 0.889: Q4.2 63.4,65.68 61.57,63.86 60.2,63.86 57.76,66.29 v57.76,68.58
N$20
  Top 0.305: R29.1 84.89,29.26 84.89,28.8 81.99,25.91 79.86,25.91 77.11,23.16 77.11,16.92 77.88,16.15 77.88,6.86 73.76,2.74 72.85,2.74 L2-OD1.2
N$21
  Top 0.305: R29.2 87.02,29.26 90.98,29.26 93.27,26.98 +_39.1
N$22
  Top 0.889: Q6.2 28.65,70.56 +12V_05.1
N$23
  Top 0.305: 42.82,62.03 44.04,62.03 M7-4.C | 42.82,62.03 40.39,62.03 R5.1 | 42.82,62.03 42.82,66.29 Q2.1
N$24  (via drill 0.35)
  Top 0.305: R6.1 36.42,61.87 38.1,61.87 39.93,60.05 40.23,60.05 R5.2 39.78,60.05 v36.73,57 | v24.99,35.97 8.53,19.51 7.47,19.51 6.71,20.27 6.71,21.18 7.92,22.4 7.92,23.16 U$1.6
  Bottom 0.305: v24.99,35.97 24.99,36.88 36.73,48.62 v36.73,57
N$25  (via drill 0.35)
  Top 0.305: v56.84,39.01 56.84,41.91 56.54,42.22 54.71,42.22 53.8,41.3 R1.1 | v53.49,35.66 53.49,33.22 49.53,29.26 49.53,21.64 40.69,12.8 v31.55,12.8
  Bottom 0.305: v53.49,35.66 v56.84,39.01 | v31.55,12.8 31.24,12.8 29.26,10.82 8.53,10.82 6.71,12.65 6.71,14.33 5.49,15.54 U$1.12
N$26
  Top 0.305: 54.41,62.03 55.63,62.03 M7-5.C | 54.41,62.03 51.82,62.03 R8.1 | 54.41,62.03 54.41,66.29 Q3.1
N$27  (via drill 0.35)
  Top 0.305: 50.83,60.73 51.66,59.89 R8.2 | 50.83,60.73 49.68,61.87 48.01,61.87 R9.1 | v5.79,33.07 3.2,30.48 3.2,26.36 5.33,24.23 5.33,23.32 U$1.7 | v33.38,51.05 40.54,51.05 41.76,52.27 41.76,54.86 43.13,56.24 46.33,56.24 50.83,60.73
  Bottom 0.305: v5.79,33.07 7.47,33.07 25.45,51.05 v33.38,51.05
N$28
  Top 0.305: R3.2 87.02,71.78 90.53,71.78 93.27,69.04 +_33.1
N$29
  Top 0.305: 31.39,49.38 32.46,49.38 M7-8.C | 31.39,49.38 28.8,49.38 R25.1 | 31.39,49.38 31.39,53.49 Q5.1
N$30
  Top 0.305: 26.98,47.4 28.65,47.4 R25.2 | 26.98,47.4 25.15,49.23 24.84,49.23 R26.1 | 26.98,47.4 21.95,42.37 21.95,37.95 8.53,24.54 7.47,24.54 6.71,23.77 6.71,22.71 5.49,21.49 5.49,20.88 U$1.9
N$31
  Top 0.305: 2N2222_1.2 54.41,39.47 55.63,40.69 55.63,41 R1.2
N$32
  Top 0.305: 43.13,49.38 44.04,49.38 M7-9.C | 43.13,49.38 40.39,49.38 R27.1 | 43.13,49.38 43.13,53.49 Q7.1
N$33  (via drill 0.35)
  Top 0.305: 38.02,47.93 36.58,49.38 R28.1 | 38.02,47.93 38.56,47.4 40.23,47.4 R27.2 | v24.99,34.75 8.53,18.29 8.08,18.29 U$1.10 | v37.95,47.7 37.95,47.85 38.02,47.93
  Bottom 0.305: v37.95,47.7 v24.99,34.75
N$34  (via drill 0.35)
  Top 0.305: v58.06,58.37 58.06,51.97 57.91,51.82 57.91,37.95 56.54,36.58 54.71,36.58 53.8,37.49 R4.1 | v57.91,64.47 57.91,67.36 58.67,68.12 58.67,72.69 57,74.37 12__13.2
  Bottom 0.305: v58.06,58.37 58.06,64.31 v57.91,64.47
N$35  (via drill 0.35)
  Top 0.305: v88.24,44.2 89.46,45.41 89.46,47.09 88.85,47.7 88.24,47.7 87.94,47.4 87.02,47.4 R23.1 | v78.94,32.46 78.94,31.85 76.5,29.41 76.5,20.27 | v76.5,16.31 76.5,20.27 | v70.1,18.9 71.02,17.98 73.15,17.98 74.68,19.51 74.68,19.66 75.29,20.27 76.5,20.27
  Bottom 0.305: v88.24,44.2 84.58,44.2 78.94,38.56 v78.94,32.46 | v76.5,16.31 77.72,16.31 80.31,13.72 L2-OD7.3 | v70.1,18.9 68.58,18.9 61.11,26.36 61.11,27.58 55.78,32.92 38.25,32.92 33.83,28.5 28.35,28.5 U$1.37
N$36
  Top 0.305: R35.1 42.67,37.8 42.67,36.12 43.43,35.36 44.2,35.36 46.18,37.34 46.18,52.73 52.27,58.83 54.25,58.83 56.24,60.81 56.84,60.81 58.22,62.18 58.22,63.55 59.59,64.92 59.59,73.61 60.35,74.37 12__13.1
N$37  (via drill 0.35)
  Top 0.305: R37.1 64.31,51.05 v63.7,51.66
  Bottom 0.305: v63.7,51.66 63.7,51.97 68.43,56.69 68.43,69.95 64.01,74.37 14__16.2
N$38
  Bottom 0.889: Q9.2 52.27,53.8 52.27,61.27 55.93,64.92 55.93,71.93 53.49,74.37 10__11.1
N$39
  Top 0.305: 54.86,49.38 55.78,49.38 M7-10.C 54.86,49.38 | 54.86,49.38 51.97,49.38 R31.1 | 54.86,49.38 54.86,53.65 Q9.1
N$40  (via drill 0.35)
  Top 0.305: R31.2 51.82,47.4 50.14,47.4 48.16,49.38 R32.1 48.01,49.38 46.79,48.16 46.79,35.2 39.01,27.43 v39.01,25.91
  Bottom 0.305: v39.01,25.91 39.01,19.05 30.18,10.21 6.55,10.21 4.12,12.65 4.12,16.15 5.33,17.37 5.33,18.14 U$1.11
N$41  (via drill 0.35)
  Top 0.305: v82.6,68.28 83.97,69.65 85.8,69.65 86.11,69.34 86.11,69.19 86.87,68.43 R13.1 | v73.3,58.98 73.3,56.24 68.28,51.21 v68.28,36.42
  Bottom 0.305: v73.3,58.98 79.63,65.3 | 79.63,65.3 v82.6,68.28 | v68.28,36.42 68.28,34.44 71.17,31.55 79.1,31.55 80.31,30.33 L2-OD2.3 | 79.63,65.3 72.85,72.08 72.85,74.83 71.02,76.66 42.98,76.66 41.3,74.98 41.3,73.91 40.08,72.69 39.32,72.69 34.29,67.67 34.29,50.75 33.68,50.14 25.45,50.14 6.71,31.39 6.71,27.89 7.47,27.13 8.53,27.13 12.34,23.32 25.76,23.32 U$1.34
N$42  (via drill 0.35)
  Top 0.305: 93.8,46.1 93.73,46.02 92.66,46.02 90.98,44.35 v90.98,44.2 | 93.8,46.1 94.94,47.24 94.94,69.49 93.88,70.56 92.81,70.56 88.09,75.29 87.02,75.29 R7.1 | v84.43,38.41 83.52,38.41 80.92,35.81 80.47,35.81 L2-OD.3 | v36.88,28.04 32.16,23.32 28.35,23.32 U$1.33 | v84.89,11.73 86.26,11.73 89.76,8.23 93.88,8.23 96.16,10.52 96.16,43.74 93.8,46.1
  Bottom 0.305: v90.98,44.2 90.22,44.2 v84.43,38.41 | v36.88,28.04 37.49,28.04 37.95,28.5 44.35,28.5 47.09,25.76 55.78,25.76 69.65,11.89 84.73,11.89 v84.89,11.73
N$43  (via drill 0.35)
  Top 0.305: R34.1 41.76,41 v41.3,40.54 | v37.03,32.92 v41.3,37.19 | v16.46,24.23 7.92,15.7 U$1.13
  Bottom 0.305: v41.3,40.54 41.3,40.23 41.45,40.08 41.45,37.34 v41.3,37.19 | v37.03,32.92 25.15,32.92 v16.46,24.23
N$44
  Top 0.305: 2N2222_3.2 43.28,39.47 44.5,40.69 44.5,41 R34.2
N$45  (via drill 0.35)
  Top 0.305: v43.74,36.27 44.5,37.03 44.5,37.8 R35.2
  Bottom 0.305: v43.74,36.27 40.39,36.27 38.56,38.1 2N2222_3.1
N$46
  Top 0.305: R30.1 85.19,32.92 85.8,32.31 85.8,32.16 87.33,30.63 90.83,30.63 92.96,28.5 94.03,28.5 94.94,27.58 94.94,19.51 93.42,17.98 91.44,17.98 87.94,14.48 83.82,14.48 82.91,13.56 82.91,4.72 80.92,2.74 80.47,2.74 L2-OD1.3
  Bottom 0.305: U$1.39 28.19,30.94 27.58,30.94 26.36,32.16 25.3,32.16 24.54,31.39 24.54,27.89 25.3,27.13 37.49,27.13 38.25,27.89 44.04,27.89 46.79,25.15 55.47,25.15 71.17,9.45 73.46,9.45 80.31,2.59 L2-OD1.3
N$47  (via drill 0.35)
  Top 0.305: v85.65,63.25 85.04,63.86 85.04,64.77 R12.1 | v78.94,48.01 78.18,48.01 77.57,47.4 77.57,43.74 78.03,43.28 79.25,43.28 v79.4,43.43 | v74.22,38.25 74.22,35.51 72.69,33.98 71.02,33.98 70.26,33.22 70.26,32.46 72.39,30.33 72.69,30.33 L2-OD2.2
  Bottom 0.305: v85.65,63.25 85.65,54.71 v78.94,48.01 | v74.22,38.25 v79.4,43.43
N$48  (via drill 0.35)
  Top 0.305: R36.1 63.09,54.25 v60.66,56.69 | v37.34,44.65 34.75,44.65 28.8,38.71 v24.69,38.71 | v9.45,23.47 v17.83,31.85
  Bottom 0.305: v60.66,56.69 60.35,56.69 48.31,44.65 v37.34,44.65 | v17.83,31.85 v24.69,38.71 | v9.45,23.47 9.45,14.63 8.08,13.26 U$1.14
N$49
  Top 0.305: R1_B.2 87.33,15.85 84.43,15.85 R1_T.1
  Bottom 0.305: U$1.1 8.08,30.94 22.25,30.94 25.15,33.83 56.08,33.83 62.03,27.89 63.7,27.89 71.17,20.42 73.3,20.42 75.29,18.44 78.64,18.44 78.79,18.59 79.4,18.59 80.62,17.37 82.75,17.37 84.28,15.85 R1_T.1
N$50
  Top 0.305: 2N2222_4.2 65.68,52.73 66.9,53.95 66.9,54.25 R36.2
N$51
  Top 0.305: R37.2 66.9,51.05 66.9,50.75 65.99,49.84 62.48,49.84 60.96,51.36 2N2222_4.1
N$52  (via drill 0.35)
  Top 0.305: v62.48,44.5 R41.1 | v57.15,56.24 v57.15,52.27 | v65.08,72.08 67.36,74.37 14__16.1
  Bottom 0.305: v62.48,44.5 62.03,44.5 61.27,43.74 60.35,43.74 57.15,46.94 v57.15,52.27 | v57.15,56.24 57.15,64.01 56.84,64.31 56.84,69.04 59.89,72.08 v65.08,72.08
N$53  (via drill 0.35)
  Top 0.305: R45.1 64.31,37.8 v63.7,38.41 | v63.7,41.91 62.18,41.91 59.59,44.5 59.59,46.48 v59.74,46.63 | v63.7,64.16 64.62,65.08 64.62,67.67 69.65,72.69 72.69,72.69 74.37,74.37 18__17.1
  Bottom 0.305: v63.7,38.41 63.7,38.71 63.86,38.86 63.86,41.76 v63.7,41.91 | v59.74,46.63 59.74,46.94 58.37,48.31 58.37,53.19 63.7,58.52 v63.7,64.16
N$54  (via drill 0.35)
  Top 0.305: v62.64,31.09 R49.1
  Bottom 0.305: v62.64,31.09 62.18,31.09 61.42,30.33 60.5,30.33 56.08,34.75 40.23,34.75 35.2,39.78 35.2,43.74 41.76,50.29 41.76,60.96 48.01,67.21 48.01,70.1 51.82,73.91 51.82,74.98 52.88,76.05 69.34,76.05 70.87,74.52 18__17.2
N$55
  Top 0.305: R12.2 87.02,64.77 90.53,64.77 93.27,62.03 +_34.1
N$56  (via drill 0.35)
  Top 0.305: v86.11,52.27 86.87,53.03 86.87,54.25 R19.1 | v83.52,39.32 v83.52,46.94 | v42.37,32 37.34,32 29.87,24.54 27.89,24.54 26.67,25.76 25.91,25.76 U$1.36 | v79.1,17.68 79.1,17.98 80.31,19.2 L2-OD5.3
  Bottom 0.305: v86.11,52.27 86.11,49.53 v83.52,46.94 | v83.52,39.32 83.52,26.98 82.91,26.36 82.91,21.34 80.92,19.36 80.47,19.36 L2-OD5.3 | v42.37,32 45.11,32 45.26,32.16 50.29,32.16 64.77,17.68 v79.1,17.68
N$57
  Top 0.305: R1_T.2 84.43,25.91 85.65,25.91 91.59,19.96 93.12,19.96 GND_1_+5V.P$2
N$58
  Top 0.305: R14.1 84.89,57.76 81.08,57.76 75.13,51.82 69.8,51.82 69.19,51.21 69.19,27.89 72.24,24.84 72.69,24.84 L2-OD3.2
N$59
  Top 0.305: R2_T1.2 84.43,13.11 85.8,13.11 89,9.91 93.27,9.91 GND_2_+5V.P$2
N$60
  Top 0.305: R14.2 87.02,57.76 90.53,57.76 93.27,55.02 +_35.1
N$61  (via drill 0.35)
  Top 0.305: v87.02,59.28 87.02,61.27 R15.1 | v88.24,49.23 90.07,47.4 v90.07,42.37 | v85.19,24.69 80.47,24.69 L2-OD3.3 | v31.24,3.2 22.71,11.73 22.71,24.54 25.3,27.13 26.21,27.13 27.43,25.91 28.19,25.91 U$1.35
  Bottom 0.305: v87.02,59.28 87.02,50.44 v88.24,49.23 | v90.07,42.37 90.07,30.48 85.65,26.06 85.65,25.15 v85.19,24.69 85.34,24.69 85.34,22.25 88.7,18.9 88.7,15.7 92.66,11.73 93.57,11.73 94.79,10.52 94.79,5.79 90.53,1.52 71.02,1.52 69.34,3.2 v31.24,3.2
N$62
  Top 0.305: M7-6.A 9.6,41.3 9.6,43.28 11.28,44.96 11.28,50.6 10.36,51.51 3.66,51.51 2.29,50.14 REL6.COIL_2 2.13,49.99 1.22,49.07 1.22,44.35 2.29,43.28 2.29,42.37 2N2222_6.1
N$63
  Bottom 0.305: REL6.NO2 2.29,67.97 8.08,67.97 14.48,74.37 14.94,74.37 DNT_03.2
N$64  (via drill 0.35)
  Top 0.305: R40.1 62.18,47.7 61.27,48.62 60.35,48.62 58.83,47.09 v58.83,44.04 | v36.12,40.08 36.12,32 v29.87,25.76
  Bottom 0.305: v58.83,44.04 40.08,44.04 v36.12,40.08 | v29.87,25.76 29.87,19.81 28.35,18.29 U$1.16
N$65
  Top 0.305: REL6.NC1 9.75,62.94 9.75,66.14 8.08,67.82 8.08,74.37 UPT_03.2
N$66
  Top 0.305: 2N2222_7.2 65.68,46.18 66.9,47.4 66.9,47.7 R40.2
N$67
  Top 0.305: R41.2 66.9,44.5 66.9,44.2 65.99,43.28 62.48,43.28 60.96,44.81 2N2222_7.1
N$68
  Bottom 0.305: REL6.COM2 2.29,57.76 2.29,58.22 18.44,74.37 DNT_03.1
N$69  (via drill 0.35)
  Top 0.305: v82.6,29.11 82.91,29.41 82.91,32.92 84.89,34.9 84.89,36.58 R16.1 | v78.03,25.3 v78.03,29.41 | v75.59,19.36 75.59,10.97 72.85,8.23 L2-OD4.2
  Bottom 0.305: v82.6,29.11 78.33,29.11 v78.03,29.41 | v78.03,25.3 78.03,21.79 v75.59,19.36
N$70
  Top 0.889: Q10.2 17.07,66.45 17.07,66.9 22.4,72.24 23.32,72.24 25.45,74.37 40__04.1
N$71
  Top 0.305: R16.2 87.02,36.58 90.68,36.58 93.27,33.98 +_38.1
N$72  (via drill 0.35)
  Top 0.305: v90.83,11.73 93.88,11.73 95.56,13.41 95.56,37.34 93.88,39.01 92.96,39.01 91.9,40.08 87.02,40.08 R17.1 | U$1.38 25.15,27.74 24.99,27.74 22.1,24.84 22.1,11.12 30.94,2.29 69.49,2.29 71.17,3.96 73.76,3.96 v76.96,7.16
  Bottom 0.305: v90.83,11.73 88.09,14.48 87.02,14.48 85.8,13.26 85.8,11.43 82.6,8.23 80.47,8.23 L2-OD4.3 80.31,8.08 79.4,7.16 v76.96,7.16
N$74
  Top 0.305: R18.1 84.89,50.75 84.89,49.53 80.62,45.26 80.62,40.23 75.29,34.9 75.29,21.79 72.85,19.36 L2-OD5.2
N$76
  Top 0.305: R18.2 87.02,50.75 90.53,50.75 93.27,48.01 +_36.1
N$78
  Top 0.305: 19.66,62.03 20.88,62.03 M7-12.C | 19.66,62.03 17.07,62.03 R43.1 | 19.66,62.03 19.66,66.29 Q10.1
N$79
  Top 0.305: R44.1 62.18,41 61.27,41.91 60.35,41.91 58.52,40.08 58.52,37.34 50.14,28.96 50.14,21.34 40.69,11.89 25.3,11.89 24.54,12.65 24.54,16.92 25.76,18.14 U$1.17
N$80
  Top 0.305: 2N2222_10.2 65.68,39.47 66.9,40.69 66.9,41 R44.2
N$81
  Top 0.305: R45.2 66.9,37.8 66.9,37.49 65.99,36.58 62.48,36.58 60.96,38.1 2N2222_10.1
N$83
  Top 0.305: 19.66,49.38 20.73,49.38 20.88,49.53 M7-13.C | 19.66,49.38 17.07,49.38 R47.1 | 19.66,49.38 Q11.1
N$84  (via drill 0.35)
  Top 0.305: v88.54,46.79 87.78,46.02 87.02,46.02 85.04,44.04 85.04,43.74 R22.1 | v91.44,51.05 92.81,49.68 v94.03,49.68 | v91.59,19.05 88.85,19.05 v87.17,17.37
  Bottom 0.305: v88.54,46.79 88.54,48.16 v91.44,51.05 | v94.03,49.68 94.03,49.38 94.94,48.46 94.94,26.21 93.57,24.84 92.66,24.84 91.59,23.77 v91.59,19.05 | v87.17,17.37 85.65,15.85 85.65,15.24 84.89,14.48 83.82,14.48 82.91,13.56 82.91,13.26 82.14,12.5 73.91,12.5 72.85,13.56 L2-OD7.2
N$86
  Top 0.305: R22.2 87.02,43.59 87.63,43.59 90.22,41 93.27,41 +_37.1
N$89
  Top 0.305: R48.1 65.23,34.59 66.14,35.51 67.97,35.51 68.58,34.9 68.58,20.42 65.99,17.83 65.99,10.52 68.89,7.62 68.89,6.55 67.97,5.64 65.84,5.64 60.2,11.28 24.99,11.28 23.93,12.34 23.93,18.14 25.3,19.51 26.98,19.51 28.19,20.73 U$1.18
N$90
  Top 0.305: 2N2222_12.2 65.84,32.77 67.06,33.98 67.06,34.29 R48.2
N$91
  Top 0.305: R49.2 67.06,31.09 67.06,30.79 66.14,29.87 62.64,29.87 61.11,31.39 2N2222_12.1
N$101
  Top 0.305: M7-2.A 78.94,41.91 73,41.91 72.08,42.82 2N2222_8.1 71.93,42.98 70.71,44.2 70.71,45.87 71.48,46.63 71.48,49.99 REL8.COIL_2
N$103
  Top 0.889: 78.03,67.97 79.1,67.97 REL8.NO1 | 78.03,67.97 71.63,67.97 REL8.NO2 | 78.03,67.97 78.03,74.37 FIL__21.2
N$106  (via drill 0.51)
  Top 0.889: v81.38,68.43 81.38,59.89 79.25,57.76 REL8.COM1
  Bottom 0.889: REL8.COM2 71.63,57.76 79.1,57.76 REL8.COM1 | v81.38,68.43 81.38,74.37 FIL__21.1
N$109  (via drill 0.35)
  Top 0.305: v74.83,43.13 76.35,43.13 R24.1 | v67.21,28.19 66.29,27.28 66.29,24.38 67.21,23.47 67.21,20.88 66.75,20.42 64.31,20.42 63.7,19.81 63.7,14.33 v63.86,14.17 | v58.22,8.53 50.29,8.53 46.79,5.03 30.33,5.03 23.32,12.04 23.32,18.44 25.76,20.88 U$1.21
  Bottom 0.305: v74.83,43.13 74.52,43.13 68.73,37.34 67.97,37.34 67.21,36.58 v67.21,28.19 | v58.22,8.53 v63.86,14.17
VCC
  Top 0.635: L2-OD.4 80.31,38.25 79.1,37.03 79.1,35.2 80.31,33.98 80.31,32.92 L2-OD2.4 80.31,32.61 80.31,32 79.1,30.79 79.1,28.65 80.31,27.43 L2-OD3.4 | L2-OD5.4 80.31,21.64 78.03,19.36 78.03,17.22 79.1,16.15 80.01,16.15 L2-OD7.4 80.31,16.15 80.31,15.54 79.1,14.33 79.1,12.19 80.31,10.97 L2-OD4.4 80.31,10.67 79.1,9.45 79.1,7.62 80.31,6.4 80.31,5.33 L2-OD1.4 80.01,5.33 77.57,5.33 73.61,1.37 26.36,1.37 14.17,13.56 C5.2 | C5.2 14.02,13.87 14.02,18.59 14.94,19.51 C6.+ | U$1.3V3 5.49,13.11 5.94,13.11 7.32,11.73 11.73,11.73 13.72,13.72 C5.2 | C3.+ 37.95,24.84 42.37,20.42 43.74,20.42 45.57,22.25 45.57,22.86 IC1.2
  Bottom 0.635: 79.1,27.43 80.31,27.43 L2-OD3.4 | 79.1,27.43 78.49,27.43 77.11,28.8 70.87,28.8 68.89,26.82 67.51,26.82 C1.2 | 79.1,27.43 79.1,24.23 80.31,23.01 80.31,21.79 L2-OD5.4 | C5.2 14.02,13.72 17.07,13.72 19.05,11.73 28.96,11.73 37.95,20.73 37.95,26.36 38.56,26.98 42.37,26.98 45.57,23.77 45.57,23.01 IC1.2

### Text on the board
tValues: <<< OUTPUTS / INPUTS / VVV | 4078 | 4078 | G | 40 | 3.3V | G | 40 | 3.3V | ESP32-S2 WATER CONT - 04/02/2024 V4 | + | 12V | -